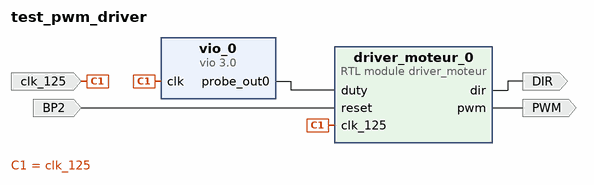
[diagram p0: block diagram of the top level]
# Vivado block design test_pwm_driver, xc7z010clg400-1, Vivado 2020.2
create_bd_design test_pwm_driver

create_bd_port -dir I clk_125
create_bd_port -dir I -type rst BP2
create_bd_port -dir O PWM
create_bd_port -dir O DIR

create_bd_cell -type ip -vlnv xilinx.com:ip:vio:3.0 vio_0
set_property -dict {CONFIG.C_NUM_PROBE_IN 0 CONFIG.C_PROBE_OUT0_WIDTH 16} [get_bd_cells vio_0]
create_bd_cell -type module -reference driver_moteur driver_moteur_0

# ---- connections ----

connect_bd_net [get_bd_pins vio_0/probe_out0] [get_bd_pins driver_moteur_0/duty]
connect_bd_net -net clk_125_0_1 [get_bd_ports clk_125] [get_bd_pins vio_0/clk] [get_bd_pins driver_moteur_0/clk_125]
connect_bd_net -net reset_0_1 [get_bd_ports BP2] [get_bd_pins driver_moteur_0/reset]
connect_bd_net [get_bd_pins driver_moteur_0/pwm] [get_bd_ports PWM]
connect_bd_net [get_bd_pins driver_moteur_0/dir] [get_bd_ports DIR]

validate_bd_design
save_bd_design
